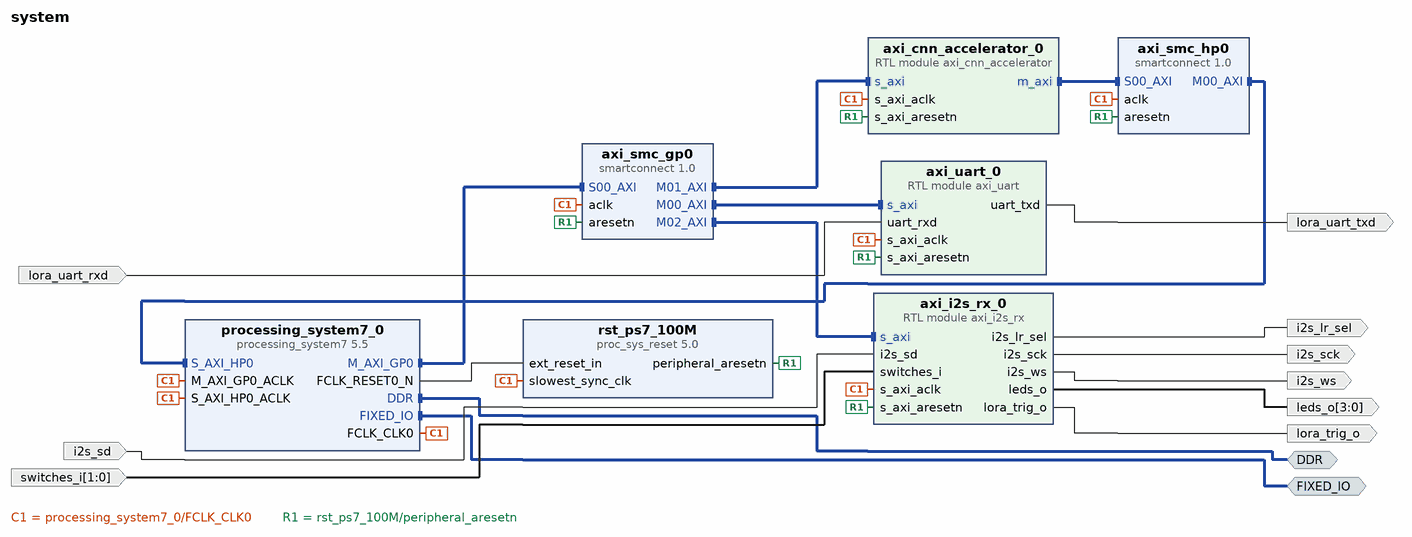
[diagram p0: block diagram of the top level]
# Vivado block design system, xc7z010clg400-1, Vivado 2026.1
create_bd_design system

create_bd_intf_port -mode Master -vlnv xilinx.com:interface:ddrx_rtl:1.0 DDR
create_bd_intf_port -mode Master -vlnv xilinx.com:display_processing_system7:fixedio_rtl:1.0 FIXED_IO
create_bd_port -dir O i2s_sck
create_bd_port -dir O i2s_ws
create_bd_port -dir I i2s_sd
create_bd_port -dir O i2s_lr_sel
create_bd_port -dir O lora_uart_txd
create_bd_port -dir I lora_uart_rxd
create_bd_port -dir O lora_trig_o
create_bd_port -dir O -from 3 -to 0 leds_o
create_bd_port -dir I -from 1 -to 0 switches_i

create_bd_cell -type ip -vlnv xilinx.com:ip:processing_system7:5.5 processing_system7_0
set_property -dict [list \
  CONFIG.PCW_APU_PERIPHERAL_FREQMHZ 666.666666 \
  CONFIG.PCW_FPGA0_PERIPHERAL_FREQMHZ 100 \
  CONFIG.PCW_PRESET_BANK1_VOLTAGE {LVCMOS 1.8V} \
  CONFIG.PCW_UART1_PERIPHERAL_ENABLE 1 \
  CONFIG.PCW_UART1_UART1_IO {MIO 48 .. 49} \
  CONFIG.PCW_UART_PERIPHERAL_FREQMHZ 100 \
  CONFIG.PCW_UIPARAM_DDR_FREQ_MHZ 533.333333 \
  CONFIG.PCW_UIPARAM_DDR_MEMORY_TYPE {DDR 3 (Low Voltage)} \
  CONFIG.PCW_UIPARAM_DDR_PARTNO {MT41K256M16 RE-125} \
  CONFIG.PCW_USE_S_AXI_HP0 1 \
] [get_bd_cells processing_system7_0]
# 65 more settings of processing_system7_0 are not shown: defaults, MIO pin electricals, DDR timing, and values the tool derives
create_bd_cell -type module -reference axi_cnn_accelerator axi_cnn_accelerator_0
create_bd_cell -type module -reference axi_i2s_rx axi_i2s_rx_0
create_bd_cell -type module -reference axi_uart axi_uart_0
create_bd_cell -type ip -vlnv xilinx.com:ip:smartconnect:1.0 axi_smc_gp0
set_property -dict {CONFIG.NUM_MI 3 CONFIG.NUM_SI 1} [get_bd_cells axi_smc_gp0]
create_bd_cell -type ip -vlnv xilinx.com:ip:smartconnect:1.0 axi_smc_hp0
set_property -dict {CONFIG.NUM_MI 1 CONFIG.NUM_SI 1} [get_bd_cells axi_smc_hp0]
create_bd_cell -type ip -vlnv xilinx.com:ip:proc_sys_reset:5.0 rst_ps7_100M

# ---- connections ----

connect_bd_intf_net [get_bd_intf_pins axi_cnn_accelerator_0/m_axi] [get_bd_intf_pins axi_smc_hp0/S00_AXI]
connect_bd_intf_net [get_bd_intf_pins axi_smc_gp0/M00_AXI] [get_bd_intf_pins axi_uart_0/s_axi]
connect_bd_intf_net [get_bd_intf_pins axi_smc_gp0/M01_AXI] [get_bd_intf_pins axi_cnn_accelerator_0/s_axi]
connect_bd_intf_net [get_bd_intf_pins axi_smc_gp0/M02_AXI] [get_bd_intf_pins axi_i2s_rx_0/s_axi]
connect_bd_intf_net [get_bd_intf_pins axi_smc_hp0/M00_AXI] [get_bd_intf_pins processing_system7_0/S_AXI_HP0]
connect_bd_intf_net [get_bd_intf_ports DDR] [get_bd_intf_pins processing_system7_0/DDR]
connect_bd_intf_net [get_bd_intf_ports FIXED_IO] [get_bd_intf_pins processing_system7_0/FIXED_IO]
connect_bd_intf_net [get_bd_intf_pins processing_system7_0/M_AXI_GP0] [get_bd_intf_pins axi_smc_gp0/S00_AXI]
connect_bd_net [get_bd_pins axi_i2s_rx_0/i2s_lr_sel] [get_bd_ports i2s_lr_sel]
connect_bd_net [get_bd_pins axi_i2s_rx_0/i2s_sck] [get_bd_ports i2s_sck]
connect_bd_net [get_bd_pins axi_i2s_rx_0/i2s_ws] [get_bd_ports i2s_ws]
connect_bd_net [get_bd_pins axi_i2s_rx_0/leds_o] [get_bd_ports leds_o]
connect_bd_net [get_bd_pins axi_i2s_rx_0/lora_trig_o] [get_bd_ports lora_trig_o]
connect_bd_net [get_bd_pins axi_uart_0/uart_txd] [get_bd_ports lora_uart_txd]
connect_bd_net [get_bd_ports i2s_sd] [get_bd_pins axi_i2s_rx_0/i2s_sd]
connect_bd_net [get_bd_ports lora_uart_rxd] [get_bd_pins axi_uart_0/uart_rxd]
connect_bd_net [get_bd_pins processing_system7_0/FCLK_CLK0] \
  [get_bd_pins processing_system7_0/M_AXI_GP0_ACLK] [get_bd_pins processing_system7_0/S_AXI_HP0_ACLK] \
  [get_bd_pins rst_ps7_100M/slowest_sync_clk] [get_bd_pins axi_smc_gp0/aclk] [get_bd_pins axi_smc_hp0/aclk] \
  [get_bd_pins axi_cnn_accelerator_0/s_axi_aclk] [get_bd_pins axi_i2s_rx_0/s_axi_aclk] [get_bd_pins axi_uart_0/s_axi_aclk]
connect_bd_net [get_bd_pins processing_system7_0/FCLK_RESET0_N] [get_bd_pins rst_ps7_100M/ext_reset_in]
connect_bd_net [get_bd_pins rst_ps7_100M/peripheral_aresetn] \
  [get_bd_pins axi_smc_gp0/aresetn] [get_bd_pins axi_smc_hp0/aresetn] [get_bd_pins axi_cnn_accelerator_0/s_axi_aresetn] \
  [get_bd_pins axi_i2s_rx_0/s_axi_aresetn] [get_bd_pins axi_uart_0/s_axi_aresetn]
connect_bd_net [get_bd_ports switches_i] [get_bd_pins axi_i2s_rx_0/switches_i]

# ---- address map ----
assign_bd_address -offset 0x00000000 -range 1G -target_address_space [get_bd_addr_spaces axi_cnn_accelerator_0/m_axi] [get_bd_addr_segs processing_system7_0/S_AXI_HP0/HP0_DDR_LOWOCM]
assign_bd_address -offset 0x43C00000 -range 64K -target_address_space [get_bd_addr_spaces processing_system7_0/Data] [get_bd_addr_segs axi_uart_0/s_axi/reg0]
assign_bd_address -offset 0x43C10000 -range 64K -target_address_space [get_bd_addr_spaces processing_system7_0/Data] [get_bd_addr_segs axi_cnn_accelerator_0/s_axi/reg0]
assign_bd_address -offset 0x43C20000 -range 64K -target_address_space [get_bd_addr_spaces processing_system7_0/Data] [get_bd_addr_segs axi_i2s_rx_0/s_axi/reg0]

validate_bd_design
save_bd_design
